# Altium schematic sheet 5.RGB_TEMP-HUMIDITY.SchDoc
size A4; DocumentNumber: 5; SheetNumber: 5
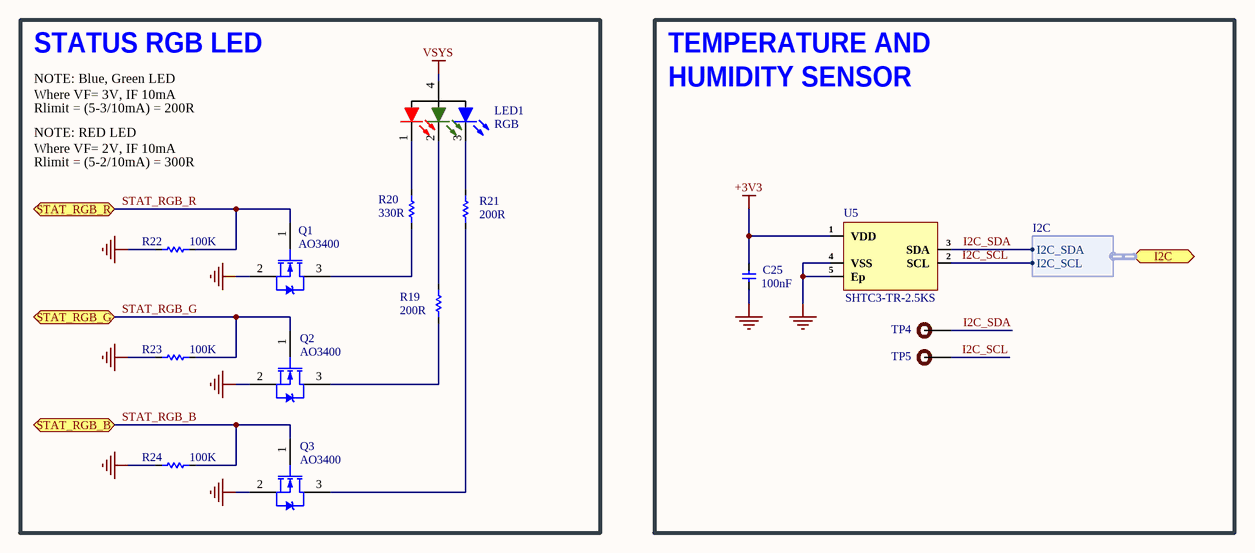
[diagram p0: 5.RGB_TEMP-HUMIDITY.SchDoc]

## Parts
C25  100nF  [cap-0402]
LED1  RGB  [LED_RGB_0606]
Q1  AO3400  [SOT-23a]
Q2  AO3400  [SOT-23a]
Q3  AO3400  [SOT-23a]
R19  200R  [Res-0402]
R20  330R  [Res-0402]
R21  200R  [Res-0402]
R22  100K  [Res-0402]
R23  100K  [Res-0402]
R24  100K  [Res-0402]
TP4  TEST POINT 0.5mm Dia  [Test-point - 0.5mm]  (value not drawn)  (no BOM)
TP5  TEST POINT 0.5mm Dia  [Test-point - 0.5mm]  (value not drawn)  (no BOM)
U5  SHTC3-TR-2.5KS  [4-WDFN Exposed Pad]

## Blocks framed on the sheet
STATUS RGB LED: LED1 Q1-Q3 R19-R24

## Ports
I2C (bidir, harness I2C), STAT_RGB_B (bidir), STAT_RGB_G (bidir), STAT_RGB_R (bidir)

## Harnesses
I2C: I2C_SCL, I2C_SDA

## Nets
+3V3: C25.1 U5.1(VDD)
GND: C25.2 Q1.2(S) Q2.2(S) Q3.2(S) R22.1 R23.1 R24.1 U5.4(VSS) U5.5(Ep)
VSYS: LED1.4(+)
I2C_SCL: TP5.1 U5.2(SCL) ; port I2C.I2C_SCL
I2C_SDA: TP4.1 U5.3(SDA) ; port I2C.I2C_SDA
STAT_RGB_B: Q3.1(G) R24.2 ; port STAT_RGB_B
STAT_RGB_G: Q2.1(G) R23.2 ; port STAT_RGB_G
STAT_RGB_R: Q1.1(G) R22.2 ; port STAT_RGB_R
NetLED1_1: LED1.1(R-) R20.2
NetLED1_2: LED1.2(G-) R19.2
NetLED1_3: LED1.3(B-) R21.2
NetQ1_3: Q1.3(D) R20.1
NetQ2_3: Q2.3(D) R19.1
NetQ3_3: Q3.3(D) R21.1

## Notes on the sheet
- NOTE: Blue, Green LED
- Where VF= 3V, IF 10mA
- Rlimit = (5-3/10mA) = 200R
- TEMPERATURE AND
- HUMIDITY SENSOR
- NOTE: RED LED
- Where VF= 2V, IF 10mA
- Rlimit = (5-2/10mA) = 300R
- ZyntelliTech
- File:
- Title:
- Date:
- Page
- Num:
- Total:
- Drawn By: Huzaifa Ali

## Library data of the parts
C25 = C1005X7R1H104KT000F: CAP CER 0.1UF 50V X7R 0402; Manufacturer: TDK; Tolerance: 10%; Voltage: 25V; Item Type: Capacitor; ComponentLink1URL: https://www.lcsc.com/product-detail/Multilayer-Ceramic-Capacitors-MLCC-SMD-SMT_TDK-C1005X7R1H104KT000F_C361198.html; ComponentLink1Description: LCSC; Supplier 1: Avnet; Manufacturer Part Number: C1005X7R1H104KT000F; RoHS: No; Category: Ceramic Capacitors; Dielectric: X7R; Supplier Part Number 1: C1005X7R1H104KT000F; LCSC Part Number: C361198
LED1 = LTST-C19HE1WT: LCSC: C458749
Q1-Q3 = NMOS-2: 30V 5.8A 35mΩ@10V,5.8A 350mW N Channel SOT-23 MOSFETs ROHS; LCSC: C181090; ComponentLink1Description: Manufacturer Link; ComponentLink1URL: http://www.irf.com/
R19 R21 = RC0402FR-07200RL: RES 200 OHM 1% 1/16W 0402; Manufacturer: Yageo; Temperature Coefficient: 100ppm/°C; Power Rating: 63mW; Voltage Rating (DC): 50V; ComponentLink1URL: https://datasheet.ciiva.com/2553/pyu-r-int-thick-7-2553232.pdf?src-supplier=Digi-Key; ComponentLink1Description: https://datasheet.ciiva.com/2553/pyu-r-int-thick-7-2553232.pdf?src-supplier=Digi-Key; ComponentLink2URL: https://datasheet.ciiva.com/7983/1018594-7983509.pdf?src-supplier=Element14; ComponentLink2Description: https://datasheet.ciiva.com/7983/1018594-7983509.pdf?src-supplier=Element14; Supplier 1: Digi-Key; Manufacturer Part Number: RC0402FR-07200RL; RoHS: Yes; Category: Chip SMD Resistors; Stock 1: 19778; Pricing 1: 1=0.10000, 10=0.01600, 100=0.00660, 1000=0.00299, 2500=0.00259, 5000=0.00214 (USD); Case/Package: 0402; Case Code (Metric): 1005; Case Code (Imperial): 0402; Size Code: 0402; Min Operating Temperature: -55°C; Max Operating Temperature: 155°C; Tolerance: 1%; Resistance: 200R; Resistor Type: Thick Film; Packaging: Tape and Reel; Voltage Rating: 50V; Package Quantity: 1; Number of Terminations: 2; Termination: SMD/SMT; Max Power Dissipation: 63mW; Features: Moisture Resistant; Series: RC; Construction: Rectangular; Resistance Tolerance: 1%; Length: 1mm; Width: 0.02inch; Height: 0.016inch; Depth: 0.5mm; REACH SVHC: No SVHC; Lead Free: Lead Free; RoHS Compliant: Yes; Military Standard: Not; ComponentLink3URL: https://datasheet.ciiva.com/16804/pyu-rc0402-51-rohs-l-6-r-16804406.pdf?src-supplier=Future+Electronics; ComponentLink3Description: https://datasheet.ciiva.com/16804/pyu-rc0402-51-rohs-l-6-r-16804406.pdf?src-supplier=Future+Electronics; ComponentLink4URL: https://datasheet.ciiva.com/15189/getdatasheetpartid-331152-15189383.pdf?src-supplier=Verical; ComponentLink4Description: https://datasheet.ciiva.com/15189/getdatasheetpartid-331152-15189383.pdf?src-supplier=Verical; ComponentLink5URL: https://datasheet.ciiva.com/7849/1018594-7849898.pdf?src-supplier=Element14; ComponentLink5Description: https://datasheet.ciiva.com/7849/1018594-7849898.pdf?src-supplier=Element14; ComponentLink6URL: https://datasheet.ciiva.com/5562/pyu-rc0402-51-rohs-l-6-r-8721-5562539.pdf?src-supplier=Mouser; ComponentLink6Description: https://datasheet.ciiva.com/5562/pyu-rc0402-51-rohs-l-6-r-8721-5562539.pdf?src-supplier=Mouser; ComponentLink7URL: https://datasheet.ciiva.com/7849/1018594-7849899.pdf?src-supplier=Element14; ComponentLink7Description: https://datasheet.ciiva.com/7849/1018594-7849899.pdf?src-supplier=Element14; ComponentLink8URL: https://datasheet.ciiva.com/2553/pyu-r-int-thick-7-2553230.pdf?src-supplier=Digi-Key; ComponentLink8Description: https://datasheet.ciiva.com/2553/pyu-r-int-thick-7-2553230.pdf?src-supplier=Digi-Key; ComponentLink9URL: https://datasheet.ciiva.com/2553/pyu-r-int-thick-7-2553231.pdf?src-supplier=Digi-Key; ComponentLink9Description: https://datasheet.ciiva.com/2553/pyu-r-int-thick-7-2553231.pdf?src-supplier=Digi-Key; Supplier Part Number 1: 311-200LRCT-ND; LCSC Part Number: C114764
R20 = RK73H1ETTP3300F: RES 330 OHM 1% 1/10W 0402; Manufacturer: KOA Speer; Power Rating: 63mW; Voltage Rating: 50V; Temperature Coefficient: 100ppm/°C; Max Power Dissipation: 100mW; Supplier: Rs; Supplier Part Number: 6317972; Manufacturer Part Number: RK73H1ETTP3300F; RoHS: Yes; Category: Chip SMD Resistors; Stock: 36500; Pricing: 100=0.007, 1000=0.006, 2500=0.006, 5000=0.006, 10000=0.005 (GBP); Case/Package: 0402; Case Code (Imperial): 0402; Case Code (Metric): 1005; Min Operating Temperature: -55°C; Max Operating Temperature: 155°C; Value: 330R; Tolerance: 1%; Packaging: Tape and Reel; Package Quantity: 10000; Termination: SMD/SMT; Voltage Rating (DC): 50V; Series: RK73H; Construction: Rectangular; Features: Moisture Resistant,Automotive AEC-Q200; Number of Terminations: 2; Length: 1mm; Width: 0.5mm; Height: 0.35mm; LCSC Part Number: C159971; Ratings: AEC-Q200; Military Standard: Not; Lead Free: Lead Free; RoHS Compliant: Yes; ComponentLink1URL: https://datasheet.ciiva.com/5555/rk73h-5555909.pdf?src-supplier=Mouser; ComponentLink1Description: https://datasheet.ciiva.com/5555/rk73h-5555909.pdf?src-supplier=Mouser; ComponentLink2URL: https://datasheet.ciiva.com/15203/getdatasheetpartid-424481-15203100.pdf?src-supplier=Verical; ComponentLink2Description: https://datasheet.ciiva.com/15203/getdatasheetpartid-424481-15203100.pdf?src-supplier=Verical
R22-R24 = RC0402FR-07100KL: RES 100K OHM 1% 1/16W 0402; Manufacturer: Yageo; Temperature Coefficient: 100ppm/°C; Power Rating: 63mW; Voltage Rating: 50V; Item Type: Resistor; Resistance: 100kR; RoHS: Yes; Category: Chip SMD Resistors; Case/Package: 0402; Case Code (Metric): 1005; Case Code (Imperial): 0402; Min Operating Temperature: -55°C; Max Operating Temperature: 155°C; Resistor Type: Thick Film; Tolerance: 1%; Packaging: Tape and Reel; Features: Moisture Resistant; Resistance Tolerance: 1%; Height: 0.016inch; Lead Free: Lead Free; RoHS Compliant: Yes; ComponentLink1URL: https://datasheet.ciiva.com/11819/0900766b80c66297-11819452.pdf?src-supplier=RSComponents; ComponentLink1Description: https://datasheet.ciiva.com/11819/0900766b80c66297-11819452.pdf?src-supplier=RSComponents; ComponentLink2URL: https://datasheet.ciiva.com/22747/1018594-22747509.pdf?src-supplier=Element14; ComponentLink2Description: https://datasheet.ciiva.com/22747/1018594-22747509.pdf?src-supplier=Element14; ComponentLink3URL: https://datasheet.ciiva.com/2453/pyu-r-int-thick-7-2453362.pdf?src-supplier=Digi-Key; ComponentLink3Description: https://datasheet.ciiva.com/2453/pyu-r-int-thick-7-2453362.pdf?src-supplier=Digi-Key; ComponentLink4URL: https://datasheet.ciiva.com/2453/pyu-r-int-thick-7-2453363.pdf?src-supplier=Digi-Key; ComponentLink4Description: https://datasheet.ciiva.com/2453/pyu-r-int-thick-7-2453363.pdf?src-supplier=Digi-Key; ComponentLink5URL: https://datasheet.ciiva.com/2453/pyu-r-int-thick-7-2453361.pdf?src-supplier=Digi-Key; ComponentLink5Description: https://datasheet.ciiva.com/2453/pyu-r-int-thick-7-2453361.pdf?src-supplier=Digi-Key; ComponentLink6URL: https://datasheet.ciiva.com/12667/pyu-rc0402-51-rohs-l-6-r-12667930.pdf?src-supplier=Mouser; ComponentLink6Description: https://datasheet.ciiva.com/12667/pyu-rc0402-51-rohs-l-6-r-12667930.pdf?src-supplier=Mouser; ComponentLink7URL: https://datasheet.ciiva.com/15189/getdatasheetpartid-323696-15189334.pdf?src-supplier=Verical; ComponentLink7Description: https://datasheet.ciiva.com/15189/getdatasheetpartid-323696-15189334.pdf?src-supplier=Verical; LCSC Part Number: C60491; Supplier 1: Mouser; Manufacturer Part Number: RC0402FR-07100KL; Stock 1: 7759549; Pricing 1: 1=0.10000, 10=0.01200, 50=0.01200, 100=0.00500, 1000=0.00300, 2500=0.00200, 10000=0.00100 (USD); Package Quantity: 1; Number of Terminations: 2; Termination: SMD/SMT; Max Power Dissipation: 63mW; Working Voltage: 50V; Series: RC; Construction: Rectangular; Technology: THICK FILM; Length: 0.039inch; Width: 0.02inch; Depth: 0.5mm; REACH SVHC: No SVHC; Military Standard: Not; Supplier Part Number 1: 603-RC0402FR-07100KL
TP4 TP5 = TEST POINT 0.5mm Dia: Test Point ON; Item Type: Test Point; Manufacturer Part Number: TEST POINT 0.5mm Dia
U5 = SHTC3-TR-2.5KS: SHTC3 Series Digital ±2% RH SMT Humidity Temperature Sensor - DFN-8; Manufacturer: Sensirion; Item Type: IC; Supplier: Digikey; LCSC Part Number: C194656; Manufacturer Part Number: SHTC3-TR-2.5KS; RoHS: No; Stock: 21685; Pricing: 1=2.72, 5=2.292, 10=2.129, 25=1.932, 50=1.7952, 100=1.6682, 500=1.40712, 1000=1.30776 (USD); ComponentLink1URL: https://datasheet.octopart.com/SHTC3-TR-2.5KS-Sensirion-datasheet-166628637.pdf?src-supplier=Future+Electronics; ComponentLink1Description: https://datasheet.octopart.com/SHTC3-TR-2.5KS-Sensirion-datasheet-166628637.pdf?src-supplier=Future+Electronics